# Altium schematic sheet Wiring_connection_scheme_J3.SchDoc: =DT_SCH_Title
size A4; Organization: Droid Technologies; SheetNumber: 22; SheetTotal: 22
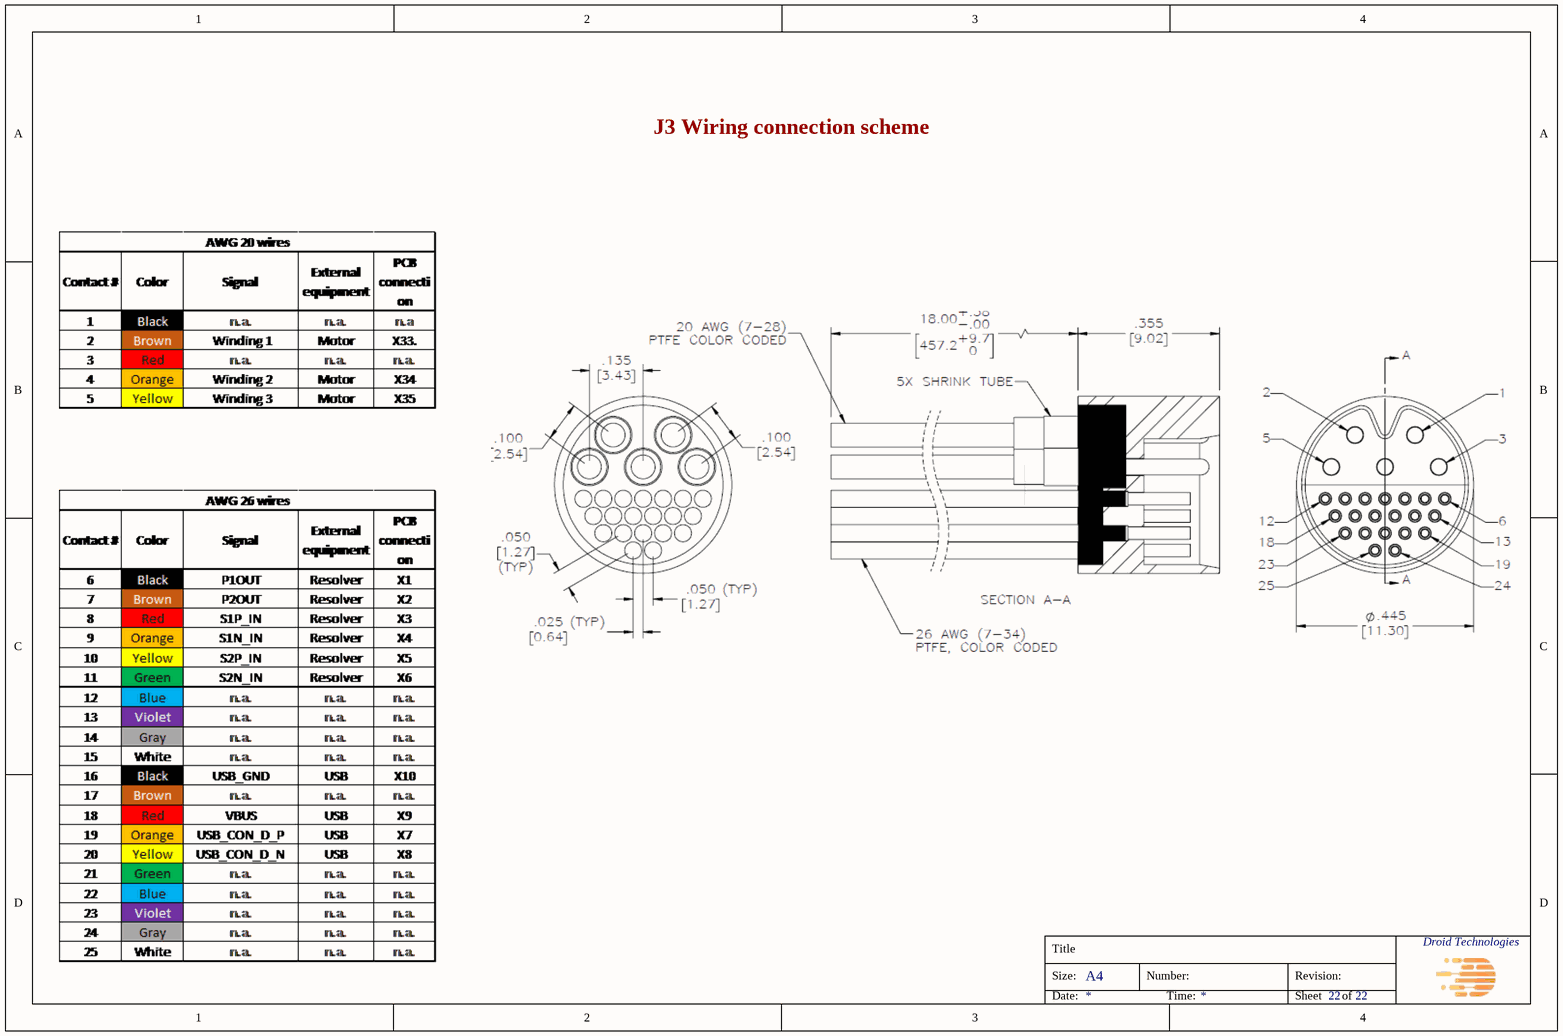
[diagram p0: Wiring_connection_scheme_J3.SchDoc]

## Notes on the sheet
- J3 Wiring connection scheme
- Title
- Size:
- A4
- Number:
- Revision:
- Date:
- Time:
- Sheet
- of